# Altium schematic sheet Button_Sheet_1.SchDoc
size A; SheetNumber: 11; SheetTotal: 12
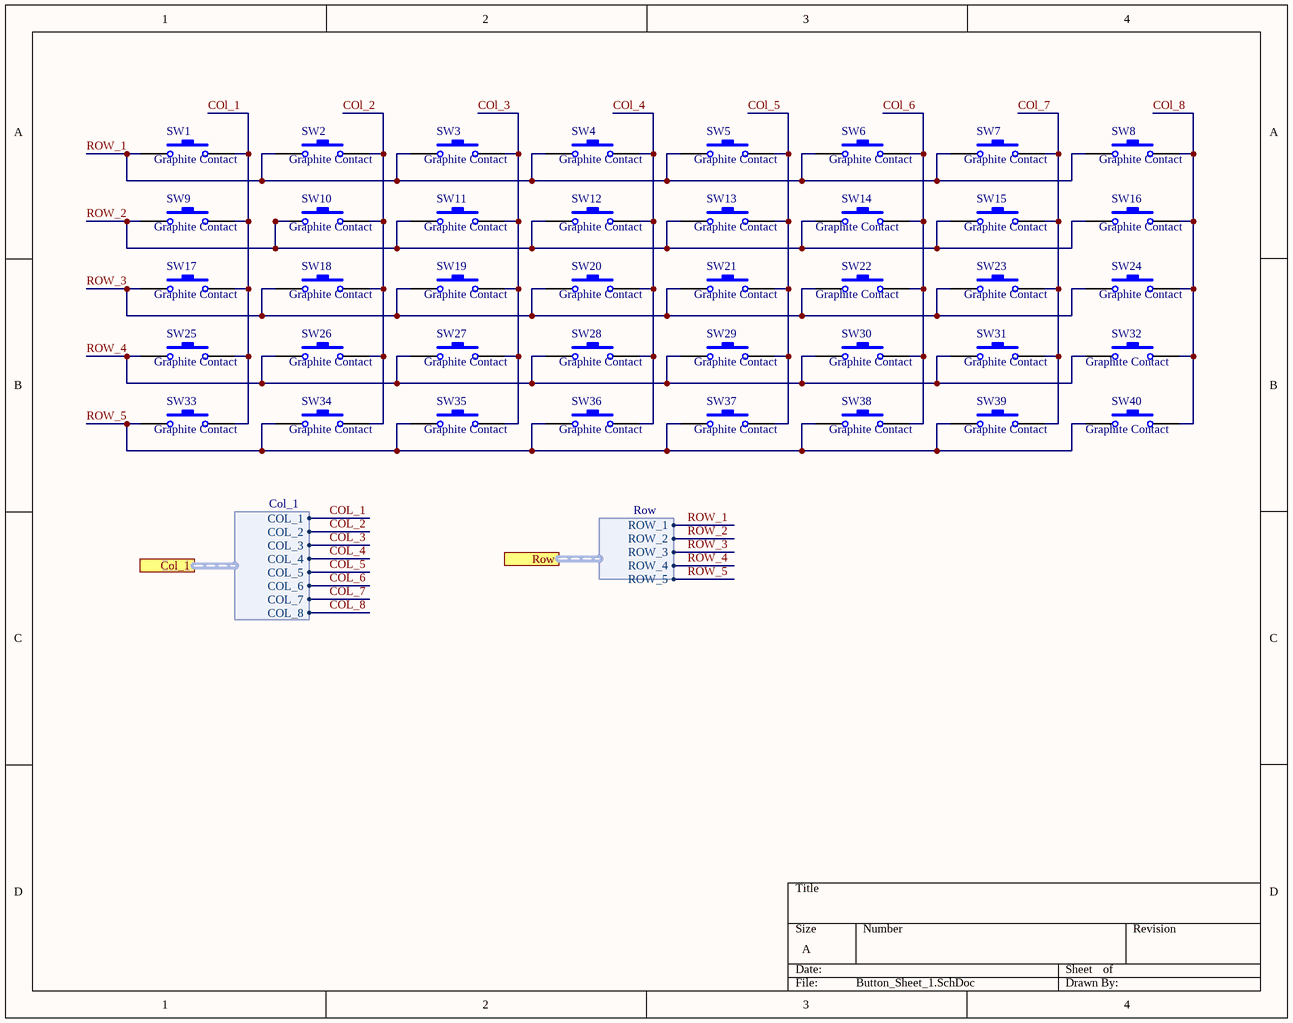
[diagram p0: Button_Sheet_1.SchDoc]

## Parts
SW1  Graphite Contact  [Graphite Contact]
SW2  Graphite Contact  [Graphite Contact]
SW3  Graphite Contact  [Graphite Contact]
SW4  Graphite Contact  [Graphite Contact]
SW5  Graphite Contact  [Graphite Contact]
SW6  Graphite Contact  [Graphite Contact]
SW7  Graphite Contact  [Graphite Contact]
SW8  Graphite Contact  [Graphite Contact]
SW9  Graphite Contact  [Graphite Contact]
SW10  Graphite Contact  [Graphite Contact]
SW11  Graphite Contact  [Graphite Contact]
SW12  Graphite Contact  [Graphite Contact]
SW13  Graphite Contact  [Graphite Contact]
SW14  Graphite Contact  [Graphite Contact]
SW15  Graphite Contact  [Graphite Contact]
SW16  Graphite Contact  [Graphite Contact]
SW17  Graphite Contact  [Graphite Contact]
SW18  Graphite Contact  [Graphite Contact]
SW19  Graphite Contact  [Graphite Contact]
SW20  Graphite Contact  [Graphite Contact]
SW21  Graphite Contact  [Graphite Contact]
SW22  Graphite Contact  [Graphite Contact]
SW23  Graphite Contact  [Graphite Contact]
SW24  Graphite Contact  [Graphite Contact]
SW25  Graphite Contact  [Graphite Contact]
SW26  Graphite Contact  [Graphite Contact]
SW27  Graphite Contact  [Graphite Contact]
SW28  Graphite Contact  [Graphite Contact]
SW29  Graphite Contact  [Graphite Contact]
SW30  Graphite Contact  [Graphite Contact]
SW31  Graphite Contact  [Graphite Contact]
SW32  Graphite Contact  [Graphite Contact]
SW33  Graphite Contact  [Graphite Contact]
SW34  Graphite Contact  [Graphite Contact]
SW35  Graphite Contact  [Graphite Contact]
SW36  Graphite Contact  [Graphite Contact]
SW37  Graphite Contact  [Graphite Contact]
SW38  Graphite Contact  [Graphite Contact]
SW39  Graphite Contact  [Graphite Contact]
SW40  Graphite Contact  [Graphite Contact]

## Ports
Col_1 (harness Col_1), Row (harness Row)

## Harnesses
Col_1: COL_8, COL_7, COL_6, COL_5, COL_4, COL_3, COL_2, COL_1
Row: ROW_5, ROW_4, ROW_3, ROW_2, ROW_1

## Nets
COl_1: SW1.2 SW9.2 SW17.2 SW25.2 SW33.2 ; port Col_1.COL_1
COl_2: SW2.2 SW10.2 SW18.2 SW26.2 SW34.2 ; port Col_1.COL_2
COl_3: SW3.2 SW11.2 SW19.2 SW27.2 SW35.2 ; port Col_1.COL_3
COl_4: SW4.2 SW12.2 SW20.2 SW28.2 SW36.2 ; port Col_1.COL_4
COl_5: SW5.2 SW13.2 SW21.2 SW29.2 SW37.2 ; port Col_1.COL_5
COl_6: SW6.2 SW14.2 SW22.2 SW30.2 SW38.2 ; port Col_1.COL_6
COl_7: SW7.2 SW15.2 SW23.2 SW31.2 SW39.2 ; port Col_1.COL_7
COl_8: SW8.2 SW16.2 SW24.2 SW32.2 SW40.2 ; port Col_1.COL_8
ROW_1: SW1.1 SW2.1 SW3.1 SW4.1 SW5.1 SW6.1 SW7.1 SW8.1 ; port Row.ROW_1
ROW_2: SW9.1 SW10.1 SW11.1 SW12.1 SW13.1 SW14.1 SW15.1 SW16.1 ; port Row.ROW_2
ROW_3: SW17.1 SW18.1 SW19.1 SW20.1 SW21.1 SW22.1 SW23.1 SW24.1 ; port Row.ROW_3
ROW_4: SW25.1 SW26.1 SW27.1 SW28.1 SW29.1 SW30.1 SW31.1 SW32.1 ; port Row.ROW_4
ROW_5: SW33.1 SW34.1 SW35.1 SW36.1 SW37.1 SW38.1 SW39.1 SW40.1 ; port Row.ROW_5

## Library data of the parts
SW1-SW40 = Graphite Contact: Push Button for Graphite Contact